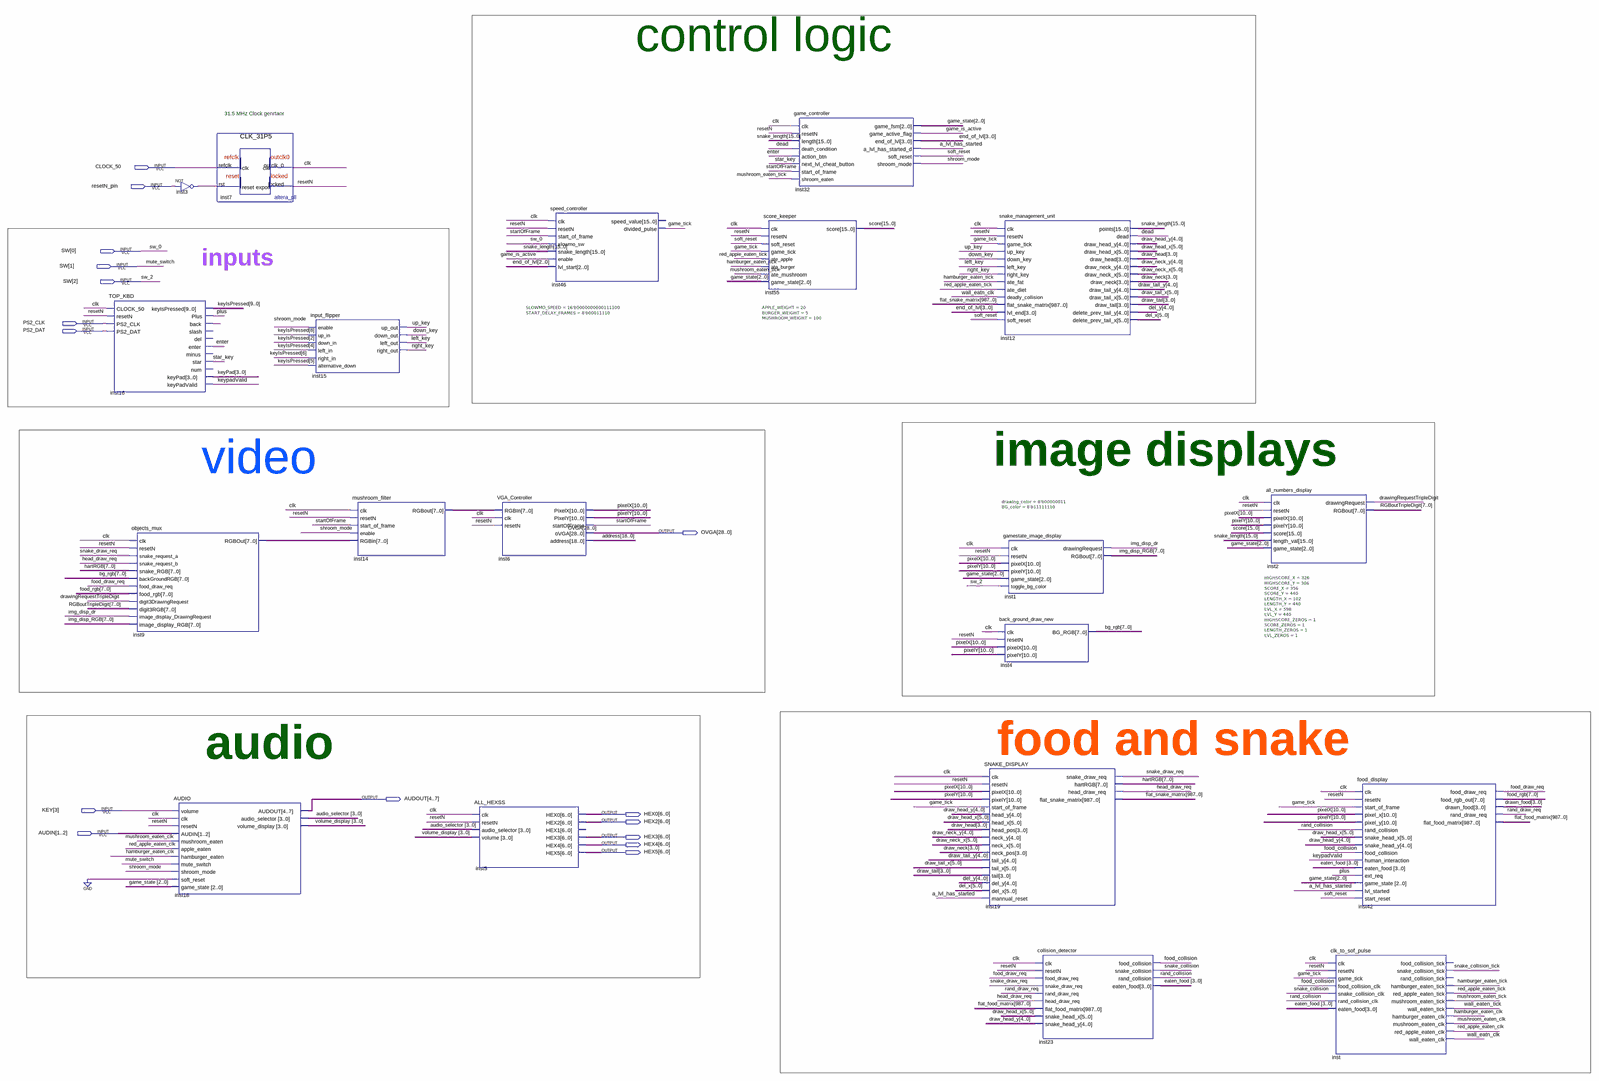
[diagram p0: schematic sheet, whole]
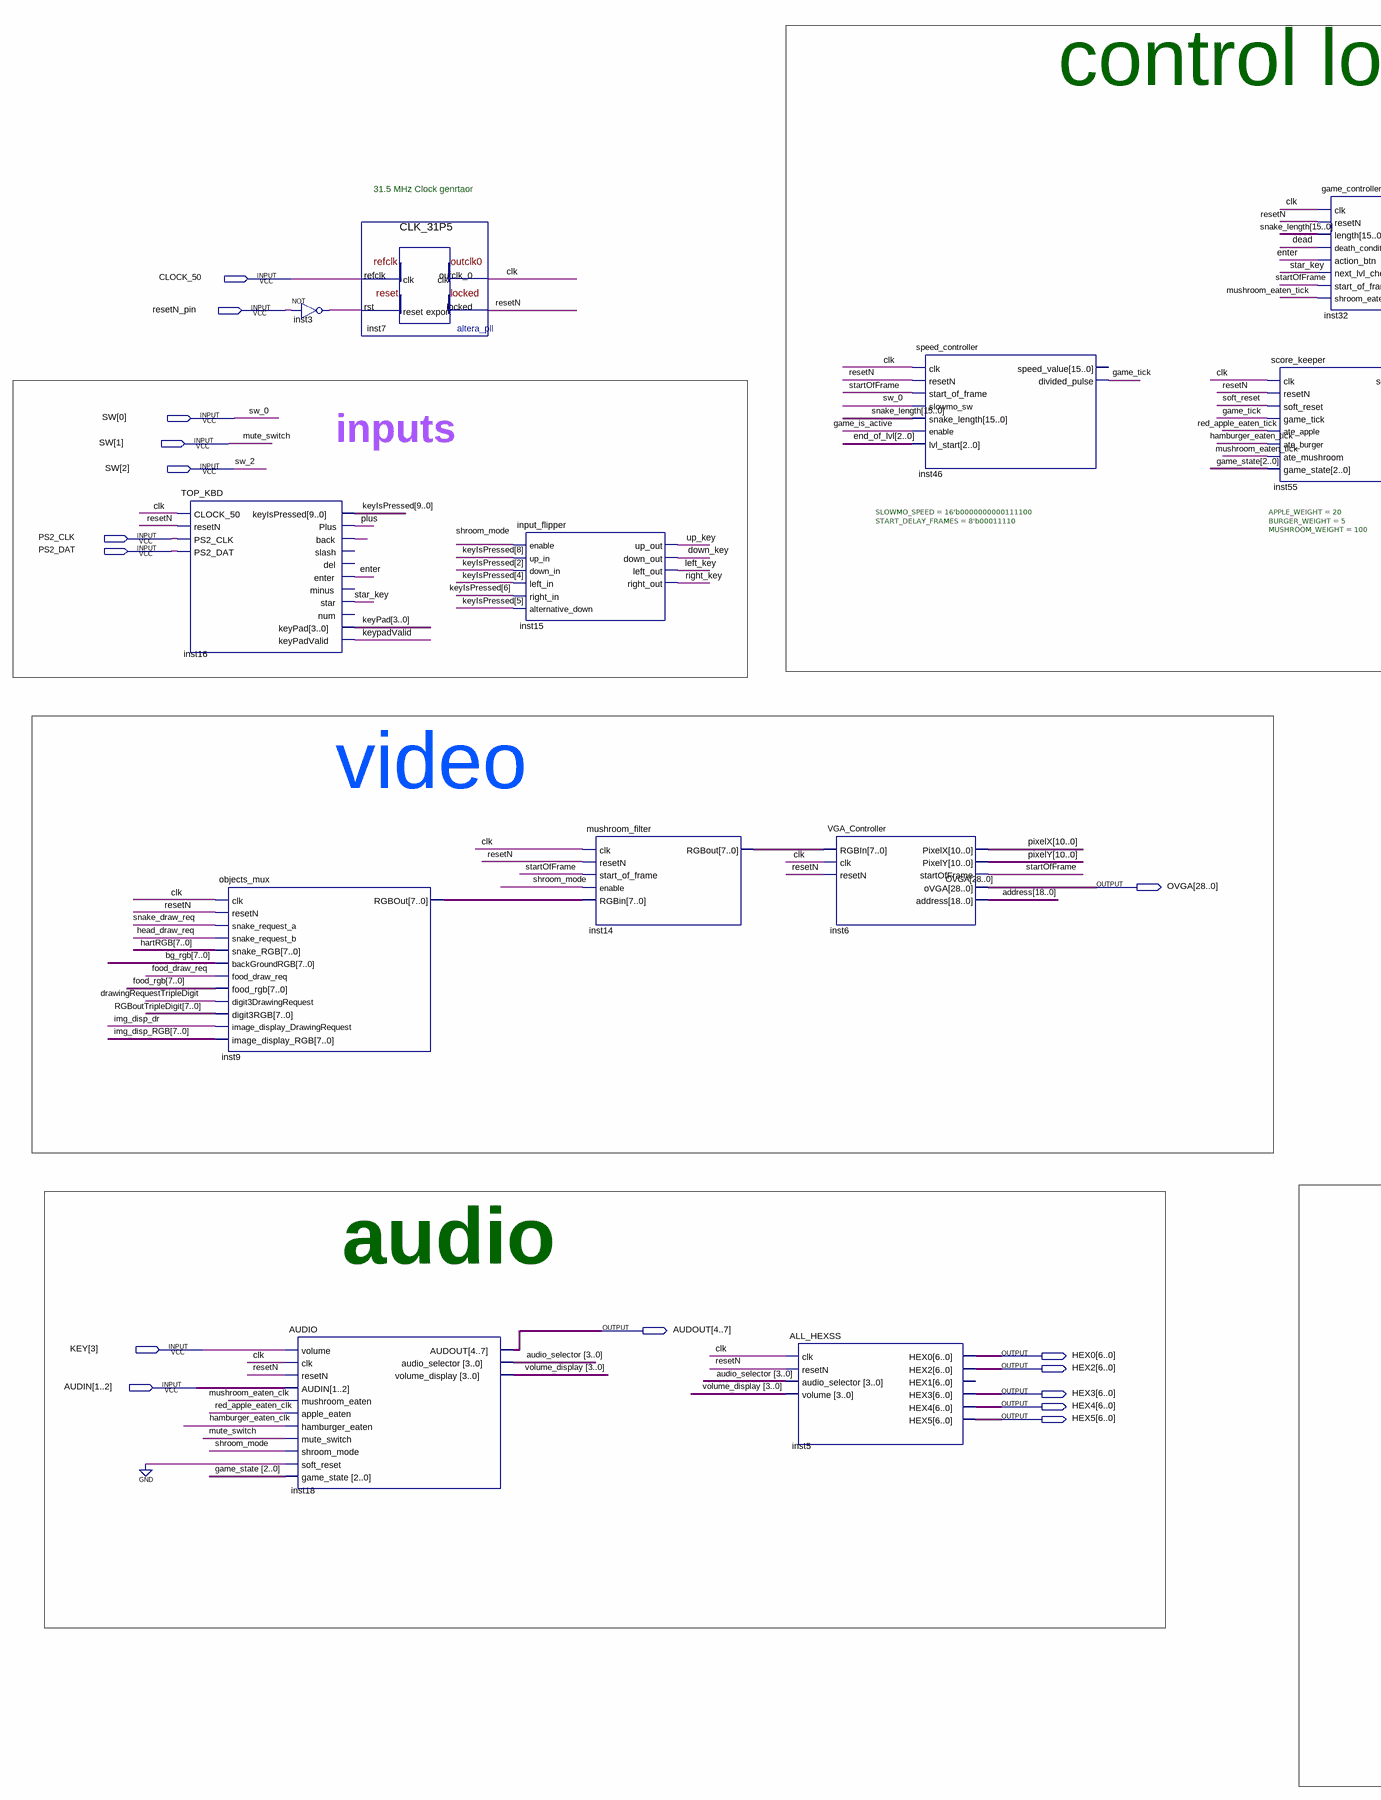
[diagram p1: schematic sheet, left part]
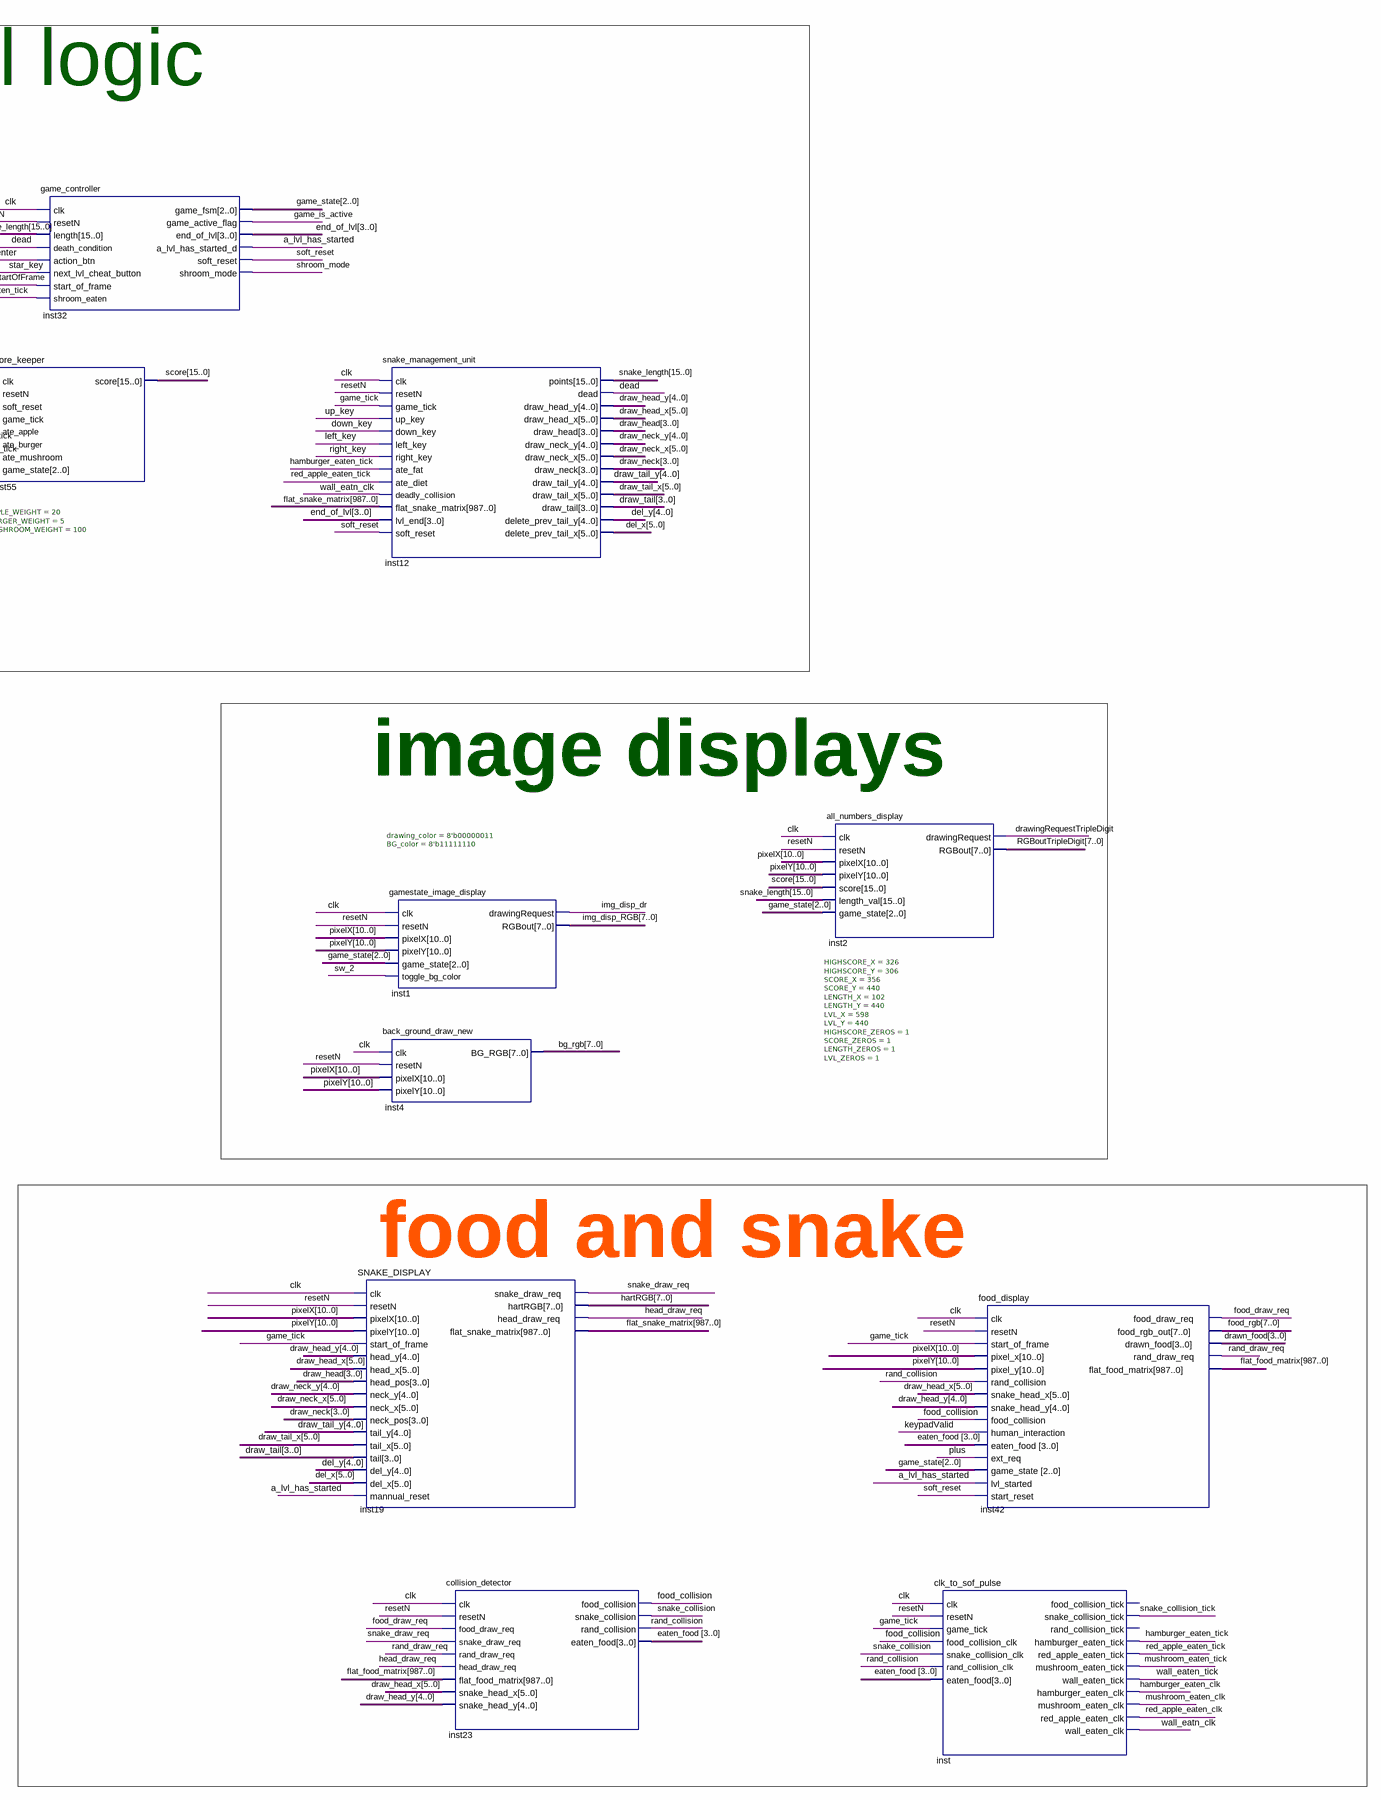
[diagram p2: schematic sheet, right part]
// Quartus schematic SNAKE_GAME_TOP.bdf as structural Verilog: 20 symbols, 16 pins
module SNAKE_GAME_TOP (
  input  CLOCK_50,
  input  resetN_pin,
  input  [2:0] SW,
  input  PS2_CLK,
  input  PS2_DAT,
  input  [3:3] KEY,
  input  [1:2] AUDIN,
  output [28:0] OVGA,
  output [4:7] AUDOUT,
  output [6:0] HEX0,
  output [6:0] HEX2,
  output [6:0] HEX3,
  output [6:0] HEX4,
  output [6:0] HEX5
);

  wire a_lvl_has_started, clk, dead, down_key, drawingRequestTripleDigit, enter, food_collision,
       food_draw_req, game_is_active, game_tick, hamburger_eaten_clk, hamburger_eaten_tick, head_draw_req,
       img_disp_dr, inst3_out, inst16_back, keypadValid, left_key, mushroom_eaten_clk, mushroom_eaten_tick,
       plus, rand_collision, rand_draw_req, red_apple_eaten_clk, red_apple_eaten_tick, resetN, right_key,
       shroom_mode, snake_collision, snake_collision_tick, snake_draw_req, soft_reset, star_key,
       startOfFrame, up_key, wall_eaten_tick, wall_eatn_clk;
  wire [2:0] game_state;
  wire [3:0] audio_selector, draw_head, draw_neck, draw_tail, drawn_food, eaten_food, end_of_lvl, keyPad,
       volume_display;
  wire [4:0] del_y, draw_head_y, draw_neck_y, draw_tail_y;
  wire [5:0] del_x, draw_head_x, draw_neck_x, draw_tail_x;
  wire [7:0] bg_rgb, food_rgb, hartRGB, img_disp_RGB, inst9_rgbout, inst14_rgbout, RGBoutTripleDigit;
  wire [9:0] keyIsPressed;
  wire [10:0] pixelX, pixelY;
  wire [15:0] score, snake_length;
  wire [18:0] address;
  wire [987:0] flat_food_matrix, flat_snake_matrix;

  TOP_KBD inst16 (
    .CLOCK_50(clk), .resetN(resetN), .PS2_CLK(PS2_CLK), .PS2_DAT(PS2_DAT), .keyIsPressed(keyIsPressed),
    .Plus(plus), .back(inst16_back), .enter(enter), .star(star_key), .keyPad(keyPad),
    .keyPadValid(keypadValid));  // open: slash, del, minus, num
  objects_mux inst9 (
    .clk(clk), .resetN(resetN), .snake_request_a(snake_draw_req), .snake_request_b(head_draw_req),
    .snake_RGB(hartRGB), .backGroundRGB(bg_rgb), .food_draw_req(food_draw_req), .food_rgb(food_rgb),
    .digit3DrawingRequest(drawingRequestTripleDigit), .digit3RGB(RGBoutTripleDigit),
    .image_display_DrawingRequest(img_disp_dr), .image_display_RGB(img_disp_RGB), .RGBOut(inst9_rgbout));
  not inst3 (inst3_out, resetN_pin);
  AUDIO inst18 (
    .volume(KEY[3]), .clk(clk), .resetN(resetN), .AUDIN(AUDIN), .mushroom_eaten(mushroom_eaten_clk),
    .apple_eaten(red_apple_eaten_clk), .hamburger_eaten(hamburger_eaten_clk), .mute_switch(SW[1]),
    .shroom_mode(shroom_mode), .soft_reset(1'b0), .game_state(game_state), .AUDOUT(AUDOUT),
    .audio_selector(audio_selector), .volume_display(volume_display));
  CLK_31P5 inst7 (.refclk(CLOCK_50), .rst(inst3_out), .outclk_0(clk), .locked(resetN));
  input_flipper inst15 (
    .enable(shroom_mode), .up_in(keyIsPressed[8]), .down_in(keyIsPressed[2]), .left_in(keyIsPressed[4]),
    .right_in(keyIsPressed[6]), .alternative_down(keyIsPressed[5]), .up_out(up_key), .down_out(down_key),
    .left_out(left_key), .right_out(right_key));
  mushroom_filter inst14 (
    .clk(clk), .resetN(resetN), .start_of_frame(startOfFrame), .enable(shroom_mode), .RGBin(inst9_rgbout),
    .RGBout(inst14_rgbout));
  ALL_HEXSS inst5 (
    .clk(clk), .resetN(resetN), .audio_selector(audio_selector), .volume(volume_display), .HEX0(HEX0),
    .HEX2(HEX2), .HEX3(HEX3), .HEX4(HEX4), .HEX5(HEX5));  // open: HEX1
  VGA_Controller inst6 (
    .RGBIn(inst14_rgbout), .clk(clk), .resetN(resetN), .PixelX(pixelX), .PixelY(pixelY),
    .startOfFrame(startOfFrame), .oVGA(OVGA), .address(address));
  speed_controller #(.SLOWMO_SPEED(16'b0000000000111100), .START_DELAY_FRAMES(8'b00011110)) inst46 (
    .clk(clk), .resetN(resetN), .start_of_frame(startOfFrame), .slowmo_sw(SW[0]),
    .snake_length(snake_length), .enable(game_is_active), .lvl_start(end_of_lvl[2:0]),
    .divided_pulse(game_tick));  // open: speed_value
  score_keeper #(.APPLE_WEIGHT(20), .BURGER_WEIGHT(5), .MUSHROOM_WEIGHT(100)) inst55 (
    .clk(clk), .resetN(resetN), .soft_reset(soft_reset), .game_tick(game_tick),
    .ate_apple(red_apple_eaten_tick), .ate_burger(hamburger_eaten_tick), .ate_mushroom(mushroom_eaten_tick),
    .game_state(game_state), .score(score));
  game_controller inst32 (
    .clk(clk), .resetN(resetN), .length(snake_length), .death_condition(dead), .action_btn(enter),
    .next_lvl_cheat_button(star_key), .start_of_frame(startOfFrame), .shroom_eaten(mushroom_eaten_tick),
    .game_fsm(game_state), .game_active_flag(game_is_active), .end_of_lvl(end_of_lvl),
    .a_lvl_has_started_d(a_lvl_has_started), .soft_reset(soft_reset), .shroom_mode(shroom_mode));
  snake_management_unit inst12 (
    .clk(clk), .resetN(resetN), .game_tick(game_tick), .up_key(up_key), .down_key(down_key),
    .left_key(left_key), .right_key(right_key), .ate_fat(hamburger_eaten_tick),
    .ate_diet(red_apple_eaten_tick), .deadly_collision(wall_eatn_clk), .flat_snake_matrix(flat_snake_matrix),
    .lvl_end(end_of_lvl), .soft_reset(soft_reset), .points(snake_length), .dead(dead),
    .draw_head_y(draw_head_y), .draw_head_x(draw_head_x), .draw_head(draw_head), .draw_neck_y(draw_neck_y),
    .draw_neck_x(draw_neck_x), .draw_neck(draw_neck), .draw_tail_y(draw_tail_y), .draw_tail_x(draw_tail_x),
    .draw_tail(draw_tail), .delete_prev_tail_y(del_y), .delete_prev_tail_x(del_x));
  back_ground_draw_new inst4 (.clk(clk), .resetN(resetN), .pixelX(pixelX), .pixelY(pixelY), .BG_RGB(bg_rgb));
  SNAKE_DISPLAY inst19 (
    .clk(clk), .resetN(resetN), .pixelX(pixelX), .pixelY(pixelY), .start_of_frame(game_tick),
    .head_y(draw_head_y), .head_x(draw_head_x), .head_pos(draw_head), .neck_y(draw_neck_y),
    .neck_x(draw_neck_x), .neck_pos(draw_neck), .tail_y(draw_tail_y), .tail_x(draw_tail_x), .tail(draw_tail),
    .del_y(del_y), .del_x(del_x), .mannual_reset(a_lvl_has_started), .snake_draw_req(snake_draw_req),
    .hartRGB(hartRGB), .head_draw_req(head_draw_req), .flat_snake_matrix(flat_snake_matrix));
  gamestate_image_display #(.drawing_color(8'b00000011), .BG_color(8'b11111110)) inst1 (
    .clk(clk), .resetN(resetN), .pixelX(pixelX), .pixelY(pixelY), .game_state(game_state),
    .toggle_bg_color(SW[2]), .drawingRequest(img_disp_dr), .RGBout(img_disp_RGB));
  collision_detector inst23 (
    .clk(clk), .resetN(resetN), .food_draw_req(food_draw_req), .snake_draw_req(snake_draw_req),
    .rand_draw_req(rand_draw_req), .head_draw_req(head_draw_req), .flat_food_matrix(flat_food_matrix),
    .snake_head_x(draw_head_x), .snake_head_y(draw_head_y), .food_collision(food_collision),
    .snake_collision(snake_collision), .rand_collision(rand_collision), .eaten_food(eaten_food));
  all_numbers_display #(.HIGHSCORE_X(326), .HIGHSCORE_Y(306), .SCORE_X(356), .SCORE_Y(440), .LENGTH_X(102), .LENGTH_Y(440), .LVL_X(598), .LVL_Y(440), .HIGHSCORE_ZEROS(1), .SCORE_ZEROS(1), .LENGTH_ZEROS(1), .LVL_ZEROS(1)) inst2 (
    .clk(clk), .resetN(resetN), .pixelX(pixelX), .pixelY(pixelY), .score(score), .length_val(snake_length),
    .game_state(game_state), .drawingRequest(drawingRequestTripleDigit), .RGBout(RGBoutTripleDigit));
  clk_to_sof_pulse inst (
    .clk(clk), .resetN(resetN), .game_tick(game_tick), .food_collision_clk(food_collision),
    .snake_collision_clk(snake_collision), .rand_collision_clk(rand_collision), .eaten_food(eaten_food),
    .snake_collision_tick(snake_collision_tick), .hamburger_eaten_tick(hamburger_eaten_tick),
    .red_apple_eaten_tick(red_apple_eaten_tick), .mushroom_eaten_tick(mushroom_eaten_tick),
    .wall_eaten_tick(wall_eaten_tick), .hamburger_eaten_clk(hamburger_eaten_clk),
    .mushroom_eaten_clk(mushroom_eaten_clk), .red_apple_eaten_clk(red_apple_eaten_clk),
    .wall_eaten_clk(wall_eatn_clk));  // open: food_collision_tick, rand_collision_tick
  food_display inst42 (
    .clk(clk), .resetN(resetN), .start_of_frame(game_tick), .pixel_x(pixelX), .pixel_y(pixelY),
    .rand_collision(rand_collision), .snake_head_x(draw_head_x), .snake_head_y(draw_head_y),
    .food_collision(food_collision), .human_interaction(keypadValid), .eaten_food(eaten_food),
    .ext_req(plus), .game_state(game_state), .lvl_started(a_lvl_has_started), .start_reset(soft_reset),
    .food_draw_req(food_draw_req), .food_rgb_out(food_rgb), .drawn_food(drawn_food),
    .rand_draw_req(rand_draw_req), .flat_food_matrix(flat_food_matrix));

  // Other names for the same wires on the sheet: mute_switch = SW[1]; sw_0 = SW[0]; sw_2 = SW[2]

  // Notes on the sheet:
  //   control logic
  //   31.5 MHz Clock genrtaor
  //   inputs
  //   image displays
  //   video
  //   food and snake
  //   audio
endmodule
